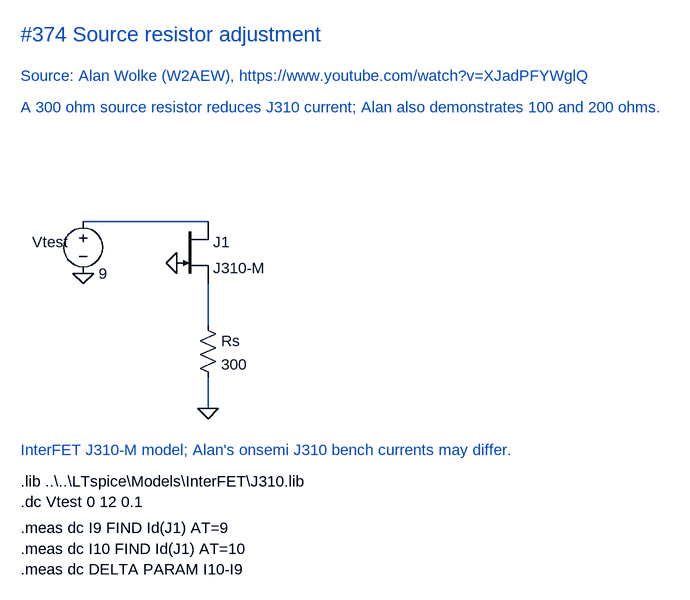
[diagram p0: schematic Source resistor adjustment.asc]
Source resistor adjustment.asc, the LTspice schematic file:
Version 4.1
SHEET 1 960 920
WIRE 128 320 320 320
WIRE 320 480 320 416
WIRE 320 608 320 560
FLAG 128 400 0
FLAG 272 384 0
FLAG 320 608 0
SYMBOL voltage 128 304 R0
WINDOW 0 -24 48 Right 2
SYMATTR InstName Vtest
SYMATTR Value 9
SYMBOL njf 272 320 R0
SYMATTR InstName J1
SYMATTR Value J310-M
SYMBOL res 304 464 R0
SYMATTR InstName Rs
SYMATTR Value 300
TEXT 32 32 Left 3 ;#374 Source resistor adjustment
TEXT 32 96 Left 2 ;Source: Alan Wolke (W2AEW), https://www.youtube.com/watch?v=XJadPFYWglQ
TEXT 32 144 Left 2 ;A 300 ohm source resistor reduces J310 current; Alan also demonstrates 100 and 200 ohms.
TEXT 32 672 Left 2 ;InterFET J310-M model; Alan's onsemi J310 bench currents may differ.
TEXT 32 720 Left 2 !.lib ..\..\LTspice\Models\InterFET\J310.lib
TEXT 32 752 Left 2 !.dc Vtest 0 12 0.1
TEXT 32 792 Left 2 !.meas dc I9 FIND Id(J1) AT=9
TEXT 32 824 Left 2 !.meas dc I10 FIND Id(J1) AT=10
TEXT 32 856 Left 2 !.meas dc DELTA PARAM I10-I9

The netlist it stands for:
* Source resistor adjustment.asc
Vtest N001 0 9
J1 N001 0 N002 J310-M
Rs N002 0 300
.model NJF NJF
.model PJF PJF
.lib standard.jft
* #374 Source resistor adjustment
* Source: Alan Wolke (W2AEW), https://www.youtube.com/watch?v=XJadPFYWglQ
* A 300 ohm source resistor reduces J310 current; Alan also demonstrates 100 and 200 ohms.
* InterFET J310-M model; Alan's onsemi J310 bench currents may differ.
.lib ..\..\LTspice\Models\InterFET\J310.lib
.dc Vtest 0 12 0.1
.meas dc I9 FIND Id(J1) AT=9
.meas dc I10 FIND Id(J1) AT=10
.meas dc DELTA PARAM I10-I9
.backanno
.end